# Altium schematic sheet Main-Sheet.SchDoc
size 420 x 297 mm; SheetNumber: 1; SheetTotal: 6
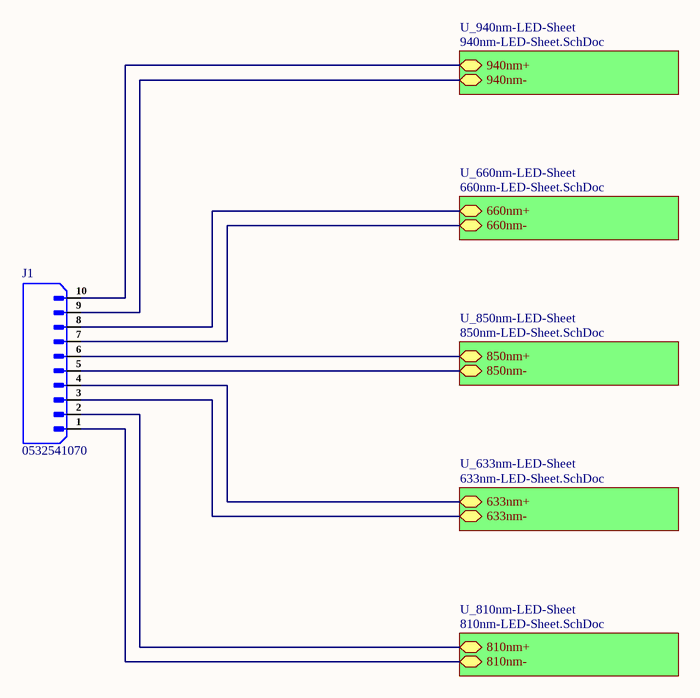
[diagram p0: Main-Sheet.SchDoc]

## Parts
J1  0532541070  [0532541070]

## Sub-sheets
U_633nm-LED-Sheet = 633nm-LED-Sheet.SchDoc: 633nm+ (bidir), 633nm- (bidir)
U_660nm-LED-Sheet = 660nm-LED-Sheet.SchDoc: 660nm+ (bidir), 660nm- (bidir)
U_810nm-LED-Sheet = 810nm-LED-Sheet.SchDoc: 810nm+ (bidir), 810nm- (bidir)
U_850nm-LED-Sheet = 850nm-LED-Sheet.SchDoc: 850nm+ (bidir), 850nm- (bidir)
U_940nm-LED-Sheet = 940nm-LED-Sheet.SchDoc: 940nm+ (bidir), 940nm- (bidir)

## Nets
NetJ1_1: J1.1 ; sheet U_810nm-LED-Sheet/810nm-
NetJ1_2: J1.2 ; sheet U_810nm-LED-Sheet/810nm+
NetJ1_3: J1.3 ; sheet U_633nm-LED-Sheet/633nm-
NetJ1_4: J1.4 ; sheet U_633nm-LED-Sheet/633nm+
NetJ1_5: J1.5 ; sheet U_850nm-LED-Sheet/850nm-
NetJ1_6: J1.6 ; sheet U_850nm-LED-Sheet/850nm+
NetJ1_7: J1.7 ; sheet U_660nm-LED-Sheet/660nm-
NetJ1_8: J1.8 ; sheet U_660nm-LED-Sheet/660nm+
NetJ1_9: J1.9 ; sheet U_940nm-LED-Sheet/940nm-
NetJ1_10: J1.10 ; sheet U_940nm-LED-Sheet/940nm+

## Notes on the sheet
- File:
- Title:
- Date:
- Page
- Num:
- Total:
- Drawn By: Huzaifa Ali

## Library data of the parts
J1 = 0532541070: CONN HEADER R/A 10POS 2MM; Manufacturer: Molex; Manufacturer Part Number: 53254-1070; Item Type: Headers and Wire Housings; Plating: Tin; Voltage Rating: 125V; Current Rating: 2A; Number of Positions: 10; Gender: Male; Number of Circuits: 9; Glow Wire Compliant: Non-compliant; Supplier: Arrow Electronics; Supplier Part Number: 53254-1070; RoHS: Yes; Stock: 4800; Pricing: 4800=0.2383, 6000=0.2327, 10000=0.2292, 20000=0.2263, 30000=0.2219, 50000=0.2176, 100000=0.2136 (USD); Mounting Technology: Through Hole; Contact Plating: Tin; Contact Material: Brass; Housing Material: Nylon; Min Operating Temperature: -40°C; Max Operating Temperature: 105°C; Number of Rows: 1; Packaging: Tray; Contact Gender: Male; Termination: Through Hole; Number of Contacts: 10; Orientation: Right Angle; Series: 53254; Pitch: 2mm; RoHS Compliant: Yes; Reach SVHC Compliant: Unknown; ComponentLink1URL: https://datasheet.ciiva.com/7810/0532541070-pcb-headers-7810534.pdf?src-supplier=Element14; ComponentLink1Description: https://datasheet.ciiva.com/7810/0532541070-pcb-headers-7810534.pdf?src-supplier=Element14